# Altium project DC Electronic Load Redemption Edition.PrjPcb
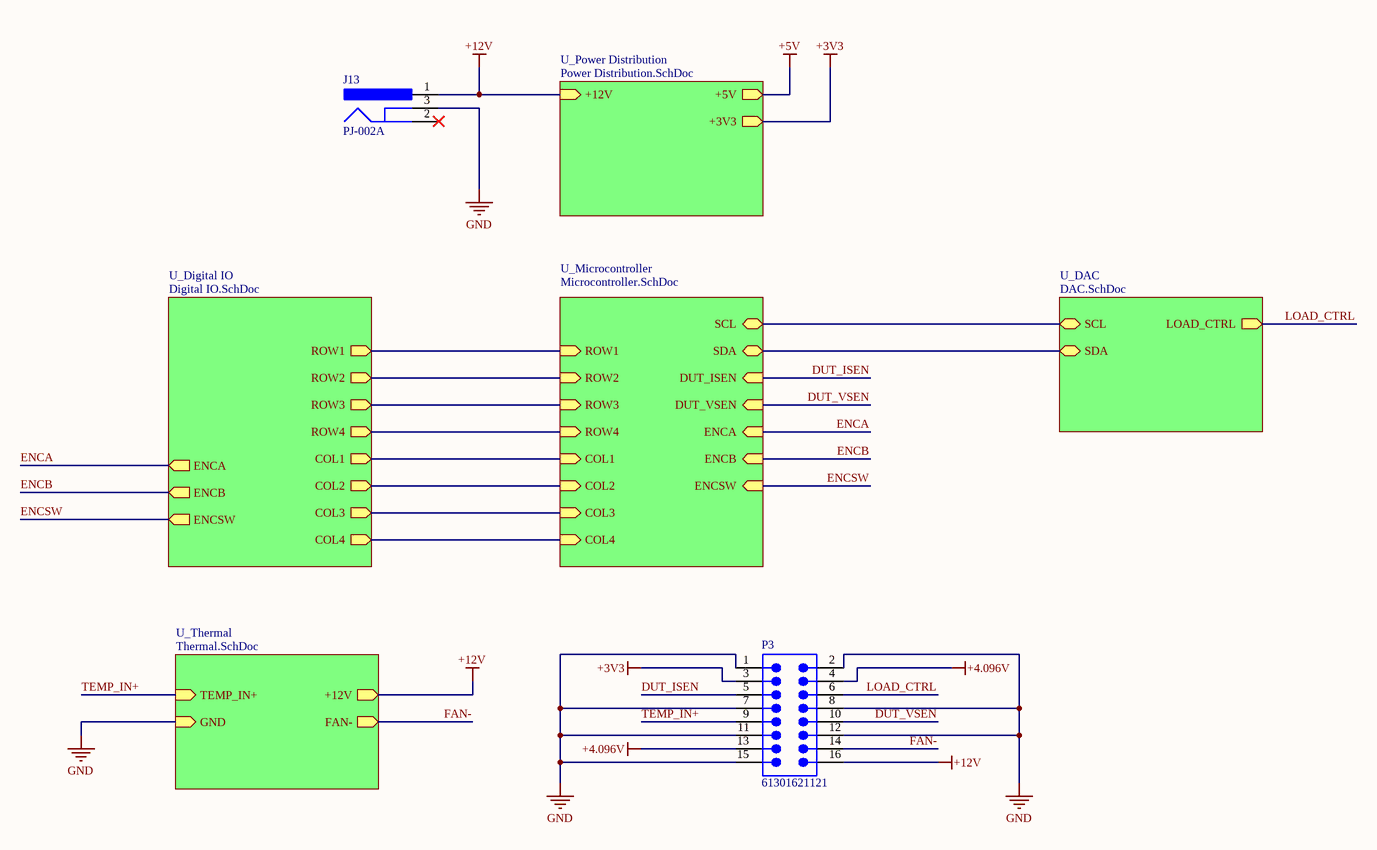
[diagram p0: Top.SchDoc]
5 sheets, 84 parts. Net scope: hierarchical (ports join the sheet entries above them; power ports are global).
Board file: DC Load Control Board.PcbDoc
Sheets:
  Top.SchDoc
    U_Power Distribution = Power Distribution.SchDoc
    U_DAC = DAC.SchDoc
    U_Thermal = Thermal.SchDoc
    U_Microcontroller = Microcontroller.SchDoc

## Sheet Top.SchDoc
size B; SheetNumber: 1; SheetTotal: 6

### Parts
J13  PJ-002A  [CUI-PJ-002A_V]
P3  61301621121  [61301621121]

### Sub-sheets
U_DAC = DAC.SchDoc: SCL (bidir), SDA (bidir), LOAD_CTRL (out)
U_Digital IO = Digital IO.SchDoc (file not in this document): ROW1 (out), ROW2 (out), ROW3 (out), ROW4 (out), COL1 (out), COL2 (out), COL3 (out), COL4 (out), ENCA (out), ENCB (out), ENCSW (out)
U_Microcontroller = Microcontroller.SchDoc: DUT_ISEN (in), DUT_VSEN (in), ROW1 (in), ROW2 (in), ROW3 (in), ROW4 (in), ENCA (in), ENCB (in), ENCSW (in), COL1 (in), COL2 (in), COL3 (in), COL4 (in), SCL (bidir), SDA (bidir)
U_Power Distribution = Power Distribution.SchDoc: +12V (in), +5V (out), +3V3 (out)
U_Thermal = Thermal.SchDoc: FAN- (out), TEMP_IN+ (in), +12V (out), GND (in)

### Nets
+3V3: P3.3 ; sheet U_Power Distribution/+3V3
+4.096V: P3.4 P3.13
+12V: J13.1 P3.16 ; sheet U_Power Distribution/+12V, sheet U_Thermal/+12V
GND: J13.3 P3.1 P3.2 P3.7 P3.8 P3.11 P3.12 P3.15 ; sheet U_Thermal/GND
COL1: sheet U_Digital IO/COL1, sheet U_Microcontroller/COL1
COL2: sheet U_Digital IO/COL2, sheet U_Microcontroller/COL2
COL3: sheet U_Digital IO/COL3, sheet U_Microcontroller/COL3
COL4: sheet U_Digital IO/COL4, sheet U_Microcontroller/COL4
DUT_ISEN: P3.5 ; sheet U_Microcontroller/DUT_ISEN
DUT_VSEN: P3.10 ; sheet U_Microcontroller/DUT_VSEN
ENCA: sheet U_Digital IO/ENCA, sheet U_Microcontroller/ENCA
ENCB: sheet U_Digital IO/ENCB, sheet U_Microcontroller/ENCB
ENCSW: sheet U_Digital IO/ENCSW, sheet U_Microcontroller/ENCSW
FAN-: P3.14 ; sheet U_Thermal/FAN-
LOAD_CTRL: P3.6 ; sheet U_DAC/LOAD_CTRL
ROW1: sheet U_Digital IO/ROW1, sheet U_Microcontroller/ROW1
ROW2: sheet U_Digital IO/ROW2, sheet U_Microcontroller/ROW2
ROW3: sheet U_Digital IO/ROW3, sheet U_Microcontroller/ROW3
ROW4: sheet U_Digital IO/ROW4, sheet U_Microcontroller/ROW4
TEMP_IN+: P3.9 ; sheet U_Thermal/TEMP_IN+
NetJ4_1: sheet U_DAC/SCL, sheet U_Microcontroller/SCL
NetJ5_1: sheet U_DAC/SDA, sheet U_Microcontroller/SDA

Not connected (* = marked no-connect by the designer): J13 2*

### Library data of the parts
J13 = CMP-2000-06895-2: Through Hole Right Angle DC Power Jack, 2.5 A, 2 mm Center Pin, 3 Position, -25 to 85 degC, RoHS, Bulk; Manufacturer: CUIInc.; Brand: CUI; Inside Contact Diameter: 2mm; Voltage Rating: 24V; Outside Contact Diameter: 6.5mm; Current Rating: 2.5A; Insulation Resistance: 50MOhms; Contact Gender: Male; Connector Type: DCPowerJack; Datasheet Version: Rev. 1.03, 04/2016; Housing Material: PolybutyleneTerephthalate(PBT); Operating Temperature Range: -25Cto+85C; Termination Style: ThroughHole; Product Category: DCPowerConnectors; Mounting Technology: ThroughHole; Mounting Style: ThroughHole; Factory Pack Quantity: 500; Contact Plating: Nickel; Package Reference: PJ-002A; Mounting Angle: Right; Package Description: 3-Pin Through Hole Device, Body 14.4 x 9 mm, Height 11 mm; Flammability Rating: UL94V-0; Manufacturer URL: http://www.cui.com/; Product: Jacks; Contact Material: Copper; Datasheet URL: http://www.cui.com/product/resource/pj-002a.pdf; RoHS: True
P3 = CMP-1502-01097-3: NexarPartId: 32855550; Contact Resistance: 20mΩ; Operating Supply Voltage: 250V; Number of Contacts: 16; Current Rating: 3A; Connector Type: Male Pin; Row Spacing: 2.54mm; Gender: Male; Min Operating Temperature: -40°C; Contact Material: Copper; RoHS: Compliant; Lead Pitch: 2.54mm; Color: Black; Contact Mating Length: 5.9944mm; REACH SVHC: Unknown; Number of Rows: 2; Orientation: Vertical; Number of Positions: 16; Max Operating Temperature: 105°C; Termination: Solder; Packaging: Bulk; Height: 8.89mm; Mount: Through Hole; Contact Plating: Gold; Voltage Rating: 250V; Number of Pins: 16; Pitch: 2.54mm

## Sheet Power Distribution.SchDoc
size B; SheetNumber: 3; SheetTotal: 6
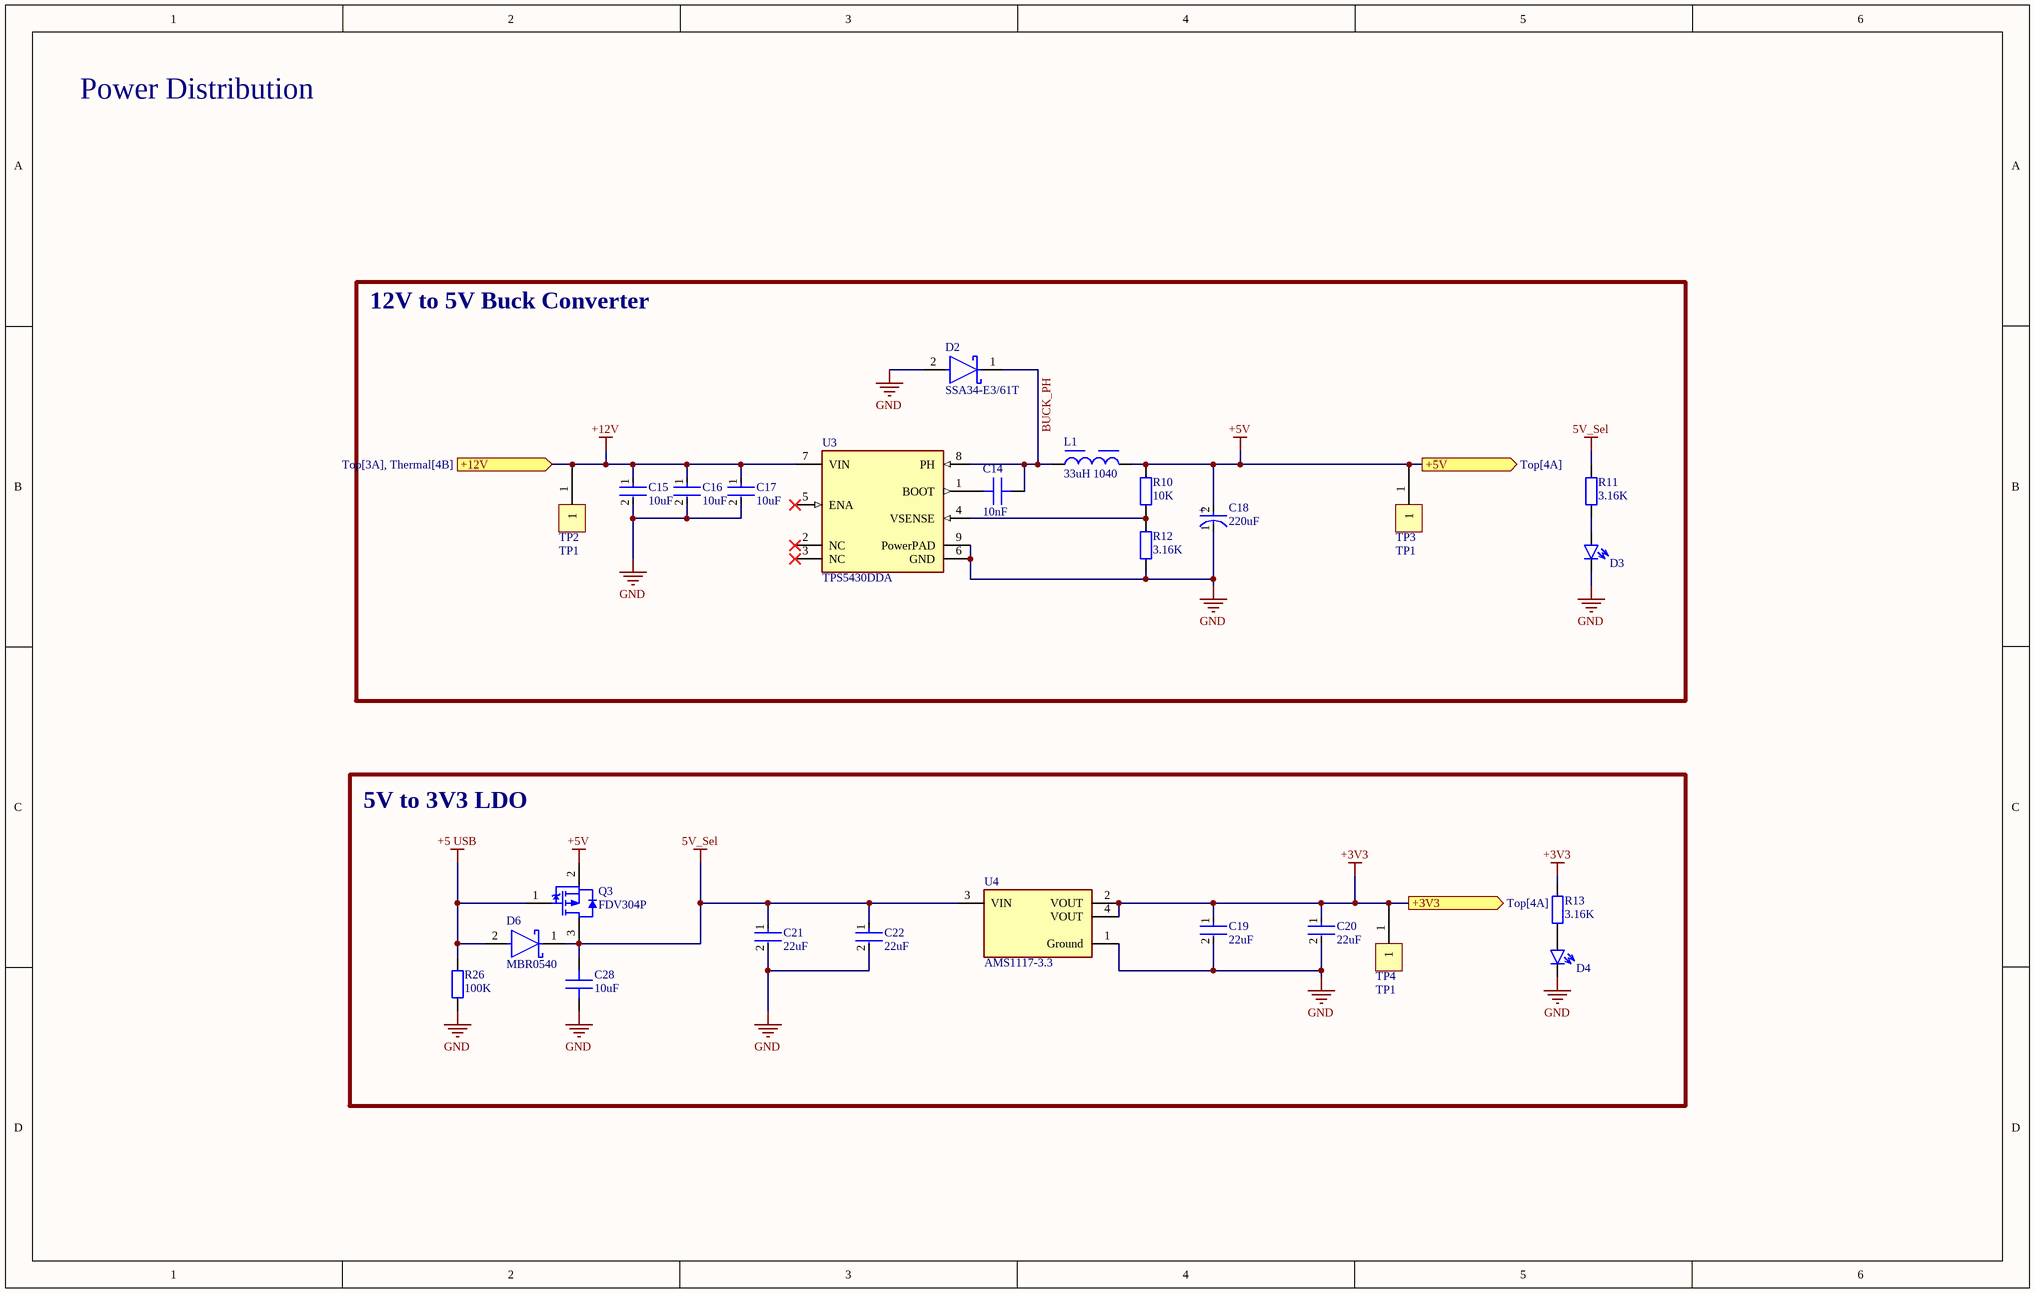
[diagram p1: Power Distribution.SchDoc]

### Parts
C14  10nF  [IPC C C0402 NO SILK]
C15  10uF  [FP-GRM21B-0_1-IPC_C]
C16  10uF  [FP-GRM21B-0_1-IPC_C]
C17  10uF  [FP-GRM21B-0_1-IPC_C]
C18  220uF  [FP-UCW1H221MNL1GS-MFG]
C19  22uF  [FP-GRM21B-0_15-MFG]
C20  22uF  [FP-GRM21B-0_15-MFG]
C21  22uF  [FP-GRM21B-0_15-MFG]
C22  22uF  [FP-GRM21B-0_15-MFG]
C28  10uF  [IPC C C0603 NO SILK]
D2  SSA34-E3/61T  [FP-95400-MFG]
D3  Generic LED 0603  [IPC C D0603]  (value not drawn)
D4  Generic LED 0603  [IPC C D0603]  (value not drawn)
D6  MBR0540  [FP-425-04-MFG]
L1  33uH 1040  [WE-LHMI_1040]
Q3  FDV304P  [FAIR-SOT23-3_V]
R10  10K  [IPC C R0402 NO SILK]
R11  3.16K  [IPC C R0402 NO SILK]
R12  3.16K  [IPC C R0402 NO SILK]
R13  3.16K  [IPC C R0402 NO SILK]
R26  100K  [IPC C R0603 NO SILK]
TP2  TP1  [TP1]
TP3  TP1  [TP1]
TP4  TP1  [TP1]
U3  TPS5430DDA  [FP-DDA0008J-MFG]
U4  AMS1117-3.3  [FP-AMS1117-IPC_C]

### Blocks framed on the sheet
12V to 5V Buck Converter: C14-C18 D2 D3 L1 R10-R12 TP2 TP3 U3
5V to 3V3 LDO: C19-C22 C28 D4 D6 Q3 R13 R26 TP4 U4

### Ports
+3V3 (out, see Top[4A]), +5V (out, see Top[4A]), +12V (in, see Top[3A], Thermal[4B])

### Nets
5V_Sel: C21.1 C22.1 C28.2 D6.1(C) Q3.3(D) R11.2 U4.3(VIN)
+3V3: C19.1 C20.1 R13.2 TP4.1 U4.2(VOUT) U4.4(VOUT) ; port +3V3
+5 USB: D6.2(A) Q3.1(G) R26.2
+5V: C18.2(A) L1.2 Q3.2(S) R10.2 TP3.1 ; port +5V
+12V: C15.1 C16.1 C17.1 TP2.1 U3.7(VIN) ; port +12V
GND: C15.2 C16.2 C17.2 C18.1(C) C19.2 C20.2 C21.2 C22.2 C28.1 D2.2(A) D3.2(C) D4.2(C) R12.1 R26.1 U3.6(GND) U3.9(PowerPAD) U4.1(Ground)
BUCK_PH: C14.2 D2.1(C) L1.1 U3.8(PH)
NetC14_1: C14.1 U3.1(BOOT)
NetD3_1: D3.1(A) R11.1
NetD4_1: D4.1(A) R13.1
NetR10_1: R10.1 R12.2 U3.4(VSENSE)

Not connected (* = marked no-connect by the designer): U3 2(NC)* 3(NC)* 5(ENA)*

### Notes on the sheet
- Power Distribution
- (in symbol CMP-12462-000041-1) +

### Library data of the parts
C14 = CMP-002-000000-1: Value: 10nF; Source: Schlib1.SchLib; Design Item ID: Generic CAP 0402
C15-C17 = CMP-2007-03453-2: GRM21BR61C106KE15L; Chip Multilayer Ceramic Capacitors for General Purpose, 0805, 10uF, X5R, 15%, 10%, 16V; Radiation Hardening: No; Thickness: 0.053inch; Voltage Rating (DC): 16V; Lead Free: Lead Free; Package Quantity: 1; Width: 1.25mm; Case Code (Imperial): 0805; Depth: 1.25mm; Packaging: Tape and Reel; Dielectric: X5R; Max Operating Temperature: 85°C; Tolerance: 10%; Voltage Rating: 16V; Voltage: 16V; Capacitance: 10uF; Height: 1.25mm; Case Code (Metric): 2012; Material: Ceramic; Mount: Surface Mount; Case/Package: 0805; REACH SVHC: No SVHC; Length: 2mm; Min Operating Temperature: -55°C; Termination: SMD/SMT
C18 = CMP-12462-000041-1: UCW1H221MNL1GS; CAP ALUM 220UF 20% 50V SMD; Dissipation Factor: 0.14%; Ripple Current: 670mA; Dielectric Material: Aluminium; Life (Hours): 7000Hour; Impedance: 350mR; Leakage Current: 3uA; Capacitance: 220uF; Max Operating Temperature: 105°C; Features: General Purpose; Voltage Rating: 50V; Case/Package: Radial; Termination: SMD/SMT; Tolerance: 20%; Package Quantity: 500; Construction: Cylindrical; REACH SVHC: No SVHC; Width: 10.3mm; Min Operating Temperature: -25°C; RoHS Compliant: Yes; Mount: Surface Mount; Diameter: 10mm; Voltage: 50V; Series: CW; Voltage Rating (DC): 50V; Ripple Current (AC): 670mA; Radiation Hardening: No; Length: 10mm; Packaging: Tape and Reel; Height: 10mm; Height - Seated (Max): 0.394inch
C19-C22 = CMP-2007-03385-2: GRM21BR60J226ME39L; Chip Multilayer Ceramic Capacitors for General Purpose, 0805, 22uF, X5R, 15%, 20%, 6.3V; Material: Ceramic; Max Operating Temperature: 85°C; Voltage: 6.3V; Min Operating Temperature: -55°C; Case/Package: 0805; Thickness: 0.053inch; Dielectric: X5R; Packaging: Tape and Reel; Depth: 1.25mm; Termination: SMD/SMT; Voltage Rating (DC): 6.3V; Radiation Hardening: No; Tolerance: 20%; Mount: Surface Mount; Lead Free: Lead Free; Package Quantity: 1; REACH SVHC: No SVHC; Voltage Rating: 6.3V; Capacitance: 22uF; Length: 2mm; Case Code (Imperial): 0805; Case Code (Metric): 2012; Width: 0.049inch; Height: 1.25mm
C28 = CMP-002-000001-1: Value: 10uF; Source: Schlib1.SchLib; Design Item ID: Generic CAP 0603
D2 = CMP-02539-000022-2: DIODE SCHOTTKY 40V 3A DO214AC; Element Configuration: Single; Max Reverse Leakage Current: 200uA; Polarity: Standard; Peak Non-Repetitive Surge Current: 75A; Forward Voltage: 490mV; Radiation Hardening: No; Current Rating: 3A; Contact Plating: Tin; Output Current: 3A; Height: 2.087mm; Mount: Surface Mount; Case/Package: SMA; Packaging: Tape and Reel; Width: 2.79mm; Average Rectified Current: 3A; Max Repetitive Reverse Voltage (Vrrm): 40V; Max Operating Temperature: 150°C; Length: 4.5mm; RoHS Compliant: Yes; Max Reverse Current: 200uA; Voltage Rating (DC): 40V; Min Operating Temperature: -65°C; Max Reverse Voltage (DC): 40V; Number of Pins: 2; Max Forward Surge Current (Ifsm): 75A; Lead Free: Lead Free; Forward Current: 3A; Max Surge Current: 75A; Package Quantity: 1
D3 D4 = CMP-006-000001-1: Design Item ID: Generic LED 0603; Source: Schlib1.SchLib
D6 = CMP-2000-05114-2: DIODE SCHOTTKY 40V 500MA SOD123; Max Surge Current: 5.5A; Max Reverse Leakage Current: 20uA; Forward Voltage: 620mV; Element Configuration: Single; Polarity: Standard; Power Dissipation: 400mW; Current Rating: 500A; Max Operating Temperature: 125°C; REACH SVHC: No SVHC; Voltage Rating (DC): 40V; Mount: Surface Mount; Max Reverse Voltage (DC): 40V; Max Forward Surge Current (Ifsm): 5.5A; Height: 1.03mm; Package Quantity: 3000; Forward Current: 500mA; Average Rectified Current: 500mA; Weight: 0.03g; Output Current: 500mA; Contact Plating: Tin; Packaging: Tape and Reel; Width: 1.6mm; Radiation Hardening: No; Peak Non-Repetitive Surge Current: 5.5A; Max Repetitive Reverse Voltage (Vrrm): 40V; Length: 2.7mm; Lead Free: Lead Free; Min Operating Temperature: -65°C; Number of Pins: 2; Peak Reverse Current: 20uA
L1 = CMP-1353-00014-4: NexarPartId: 67091305; Saturation Current: 3.3A; DC Resistance (DCR): 92mΩ; Inductance Tolerance: 20%; Inductance: 33µH; Max Operating Temperature: 125°C; Ambient Temperature Range High: 85°C; Min Operating Temperature: -40°C; Length: 11mm; Ambient Temperature Range Low: -40°C; Height: 3.8mm; Width: 10mm; RoHS: Compliant
Q3 = CMP-2000-06263-1: P-Channel Digital FET, -25 V, -0.46 A, 0.35 W, -55 to 150 degC, 3-Pin SOT-23, -55 to 150 degC, RoHS, Tape and Reel; Manufacturer: FairchildSemiconductor; Rad Hard: No; Typical Fall Time: 35ns; Typical Rise Time: 8ns; Channel Mode: Enhancement; Maximum Continuous Drain Current: 0.46A; RDS-on: 1100@4.5VmOhm; Maximum Drain Source Voltage: 25V; Package Version: Rev. 12, 03/2016; Typical Turn-On Delay Time: 6ns; Maximum Gate Source Voltage: 8V; Channel Type: P; Typical Turn-Off Delay Time: 55ns; Datasheet Version: Rev. E1, 08/1997; Package Description: 3-Pin Small Outline Transistor, Body 2.92 x 1.325 mm, Pitch 0.95 mm; Operating Temperature: -55to150°C; Package Reference: SOT23-3; Manufacturer URL: https://www.fairchildsemi.com/; Package URL: http://www.fairchildsemi.com/dwg/MA/MA03D.pdf; Package: 3SOT-23; Category: MOSFET; Packaging: Tape&Reel; Mounting: SurfaceMount; Datasheet URL: https://www.fairchildsemi.com/datasheets/FD/FDV304P.pdf; Mounting Technology: SurfaceMount
R10-R13 = CMP-008-000000-1: Generic RES 0402; Source: Schlib1.SchLib; Design Item ID: Generic RES 0402
  R10: Value: 10K
  R11-R13: Value: 3.16K
R26 = CMP-008-000001-1: Value: 100K; Source: Schlib1.SchLib; Design Item ID: Generic RES 0603
TP2-TP4 = CMP-00003-3: Testpoint double sided
U3 = CMP-2000-04960-2: IC REG BUCK ADJUSTABLE 3A 8SOPWR; Manufacturer: Texas Instruments; Max Junction Temp: +125°C; Max Supply Voltage: 36V; Switching Frequency: 500kHz; Output Type: AdjustableProgrammable; Standoff Height: 0mm; Output Voltage: 1.23-31V; Max Duty Cycle: 89%; Nominal Supply Current: 3mA; Min Supply Voltage: 5.5V; Number Of Outputs: 1; Temperature: -40°C to +125°C; Temperature Range High: +125°C; Manufacturer Part Number: TPS5430DDA; Device Class L3: Voltage Regulators - Switching; Mouser Description: Voltage Regulators - Switching Regulators 5.5 to 36V Input 3A Step Dwn Converter; Switching Topology: Buck; ComponentLink2URL: http://www.ti.com/lit/ds/symlink/tps5431.pdf; ComponentLink2Description: Datasheet; Device Class L2: Power Management ICs; Device Class L1: Integrated Circuits (ICs); Digikey Description: IC REG BUCK ADJUSTABLE 3A 8SOPWR; RoHS: TRUE; Octopart: https://octopart.com/tps5430dda-texas+instruments-589977; Output Current: 3A; Automotive: No; Lead Free: Yes; Category: IC; Package: DDA0008J; Temperature Range Low: -40°C; Height: 1.7mm
U4 = CMP-209535-000001-1: LDO Voltage Regulators 1A, 3.3V; Manufacturer: Advanced Monolithic Systems; Dropout Voltage: 1.1V; Output Type: Fixed; Nominal Supply Current: 5mA; Max Power Dissipation: 1.2W; Max Supply Voltage: 15V; Number Of Outputs: 1; Standoff Height: 0.64mm; Max Junction Temp: +125°C; Height: 1.8mm; Package: AMS1117; Device Class L2: Power Management ICs; ComponentLink2Description: Datasheet; ComponentLink2URL: http://www.advanced-monolithic.com/pdf/ds1117.pdf; Category: IC; RoHS: TRUE; Automotive: No; Device Class L1: Integrated Circuits (ICs); Output Current: 1A; Device Class L3: Voltage Regulators - Linear; Temperature: -40°C to +125°C; Output Voltage: 3.3V; Manufacturer Part Number: AMS1117-3.3; Temperature Range Low: -40°C; Octopart: https://octopart.com/ams1117-3.3-advanced+monolithic+systems-25899300; Lead Free: Yes; Ipc Land Pattern Name: SOT229P700X180-4; Temperature Range High: +125°C

## Sheet DAC.SchDoc
size B; SheetNumber: 4; SheetTotal: 6
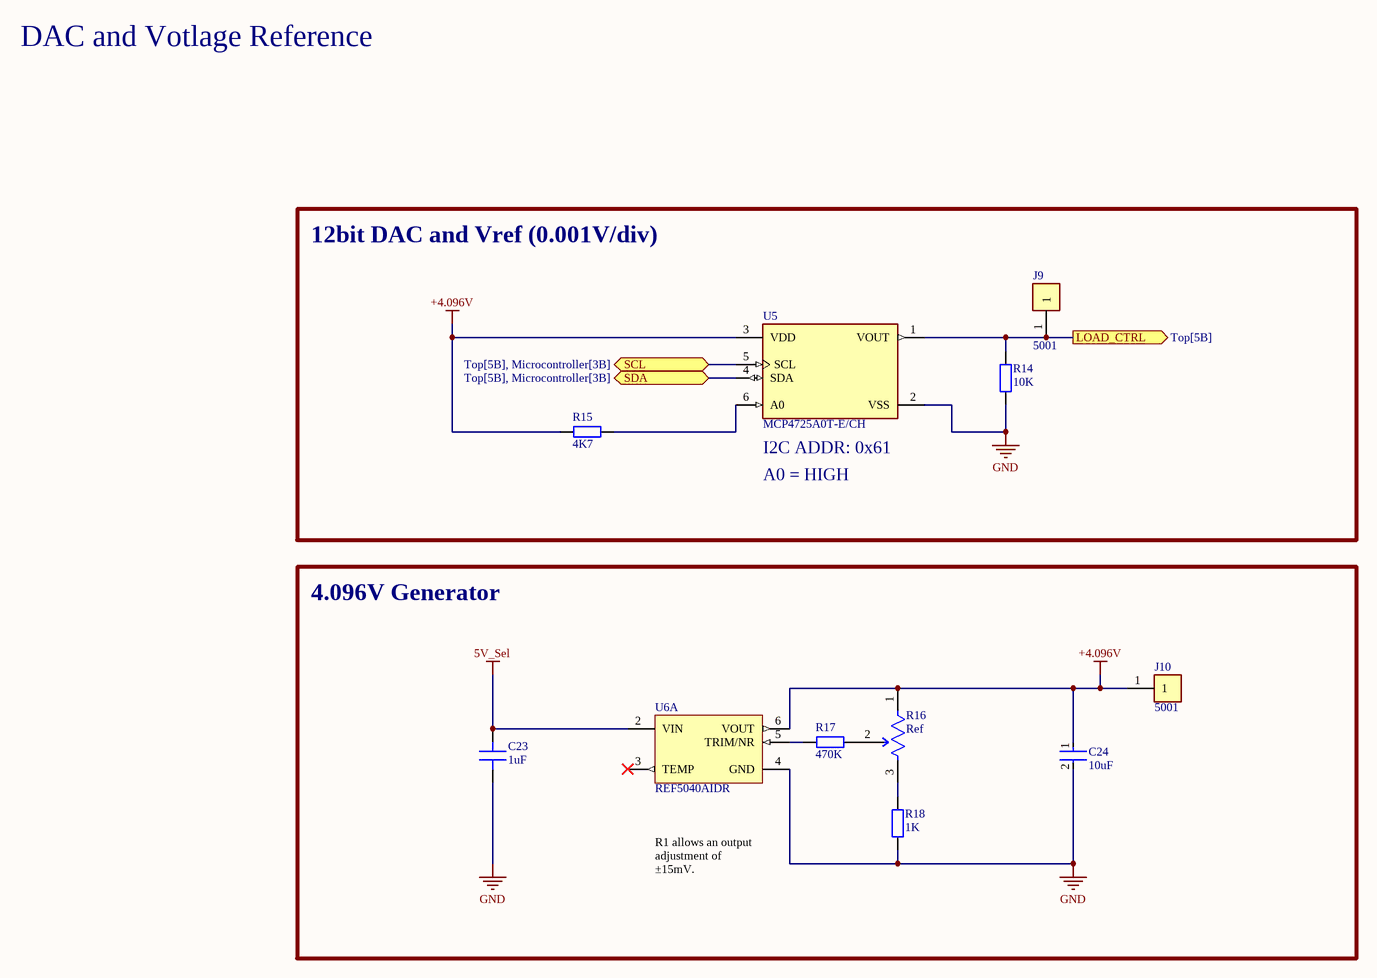
[diagram p2: DAC.SchDoc]

### Parts
C23  1uF  [IPC C C0603 NO SILK]
C24  10uF  [FP-GRM21B-0_1-IPC_C]
J9  5001  [FP-5001-MFG]
J10  5001  [FP-5001-MFG]
R14  10K  [IPC C R0402 NO SILK]
R15  4K7  [IPC C R0402 NO SILK]
R16  Ref  [FP-3296Y-MFG]
R17  470K  [IPC C R0603 NO SILK]
R18  1K  [IPC C R0402 NO SILK]
U5  MCP4725A0T-E/CH  [FP-C04-028-CHY-IPC_A]
U6  REF5040AIDR  [D0008A_M]  (part A of 2)

### Blocks framed on the sheet
12bit DAC and Vref (0.001V/div): J9 R14 R15 U5
4.096V Generator: C23 C24 J10 R16-R18 U6

### Ports
LOAD_CTRL (out, see Top[5B]), SCL (bidir, see Top[5B], Microcontroller[3B]), SDA (bidir, see Top[5B], Microcontroller[3B])

### Nets
5V_Sel: C23.2 U6.2(VIN)
+4.096V: C24.1 J10.1 R15.2 R16.1(CCW) U5.3(VDD) U6.6(VOUT)
GND: C23.1 C24.2 R14.1 R18.1 U5.2(VSS) U6.4(GND)
LOAD_CTRL: J9.1 R14.2 U5.1(VOUT) ; port LOAD_CTRL
NetJ4_1: U5.5(SCL) ; port SCL
NetJ5_1: U5.4(SDA) ; port SDA
NetR15_1: R15.1 U5.6(A0)
NetR16_2: R16.2(WIPER) R17.2
NetR16_3: R16.3(CW) R18.2
NetR17_1: R17.1 U6.5(TRIM/NR)

Not connected (* = marked no-connect by the designer): U6 3(TEMP)*

### Notes on the sheet
- DAC and Votlage Reference
- (near U5) I2C ADDR: 0x61
- A0 = HIGH
- R1 allows an output adjustment of ±15mV.

### Library data of the parts
C23 = CMP-002-000001-1: Source: Schlib1.SchLib; Design Item ID: Generic CAP 0603; Value: 1uF
C24 = CMP-2007-03453-2: as C15 on sheet Power Distribution; Radiation Hardening: No; Thickness: 0.053inch; Voltage Rating (DC): 16V; Lead Free: Lead Free; Package Quantity: 1; Width: 1.25mm; Case Code (Imperial): 0805; Depth: 1.25mm; Packaging: Tape and Reel; Dielectric: X5R; Max Operating Temperature: 85°C; Tolerance: 10%; Voltage Rating: 16V; Voltage: 16V; Capacitance: 10uF; Height: 1.25mm; Case Code (Metric): 2012; Material: Ceramic; Mount: Surface Mount; Case/Package: 0805; REACH SVHC: No SVHC; Length: 2mm; Min Operating Temperature: -55°C; Termination: SMD/SMT
J9 J10 = CMP-2000-05181-2: PC TEST POINT MINIATURE BLACK; Body Material: Bronze; Plating: Silver; Inside Diameter: 1.27mm; Hole Diameter: 1.6mm; Number of Ports: 1; Outside Diameter: 2.54mm; Insulation: Insulated; Insulation Material: Nylon; Mount: Through Hole; RoHS Compliant: Yes; Series: THM; Height: 0.3inch; Termination: Through Hole; Material: Nylon; Packaging: Bulk; Contact Material: Bronze; REACH SVHC: No SVHC; Contact Plating: Silver; Orientation: Straight; Lead Free: Lead Free; Package Quantity: 100; Length: 7.62mm; Flammability Rating: UL94 V-0; Number of Contacts: 1; Diameter: 2.54mm; Housing Color: Black; Color: Black
R14 R15 R18 = CMP-008-000000-1: Source: Schlib1.SchLib; Design Item ID: Generic RES 0402
  R14: Value: 10K
  R15: Value: 4K7
  R18: Value: 1K
R16 = CMP-07234-000015-2: TRIMMER 10K OHM 0.5W PC PIN TOP; Manufacturer Series: 3296; Actuator Orientation: Vertical; Power Rating: 500mW; Temperature Coefficient: 100ppm/°C; Resistance Tolerance: 10%; Resistance Law: Linear; Number of Turns: 25; Actuator Type: SCREW; Number of Terminals/Pins: 3; Insulation Resistance: 1GR; Resistance: 10k; Military Standard: Not; REACH SVHC: No SVHC; Lead Free: Lead Free; Resistor Type: Cermet; Max Operating Temperature: 125°C; Radiation Hardening: No; Package Quantity: 50; Mount: Panel; Max Power Dissipation: 500mW; Min Operating Temperature: -55°C; Type: Potentiometer; Terminal Finish: Tin; Termination: Pin; Taper: Linear; Color: Blue; Technology: CERMET; Packaging: Rail/Tube; Weight: 0.03oz; Height: 0.395inch; Number of Pins: 3; RoHS Compliant: Yes; Width: 9.53mm; Tolerance: 10%; Depth: 4.83mm; Series: 3296; Length: 9.53mm
R17 = CMP-008-000001-1: Value: 470K; Source: Schlib1.SchLib; Design Item ID: Generic RES 0603
U5 = CMP-0188-00760-3: IC DAC 12BIT V-OUT SOT23-6; Number of Outputs: 1; Supply Type: Single; Integral Nonlinearity (INL): 14.5LSB; Polarity: Unipolar; Number of Bits: 12; Min Supply Voltage: 2.7V; Output Type: Voltage; Settling Time: 6us; Max Supply Voltage: 5.5V; Nominal Supply Current: 210uA; Resolution: 12b; Interface: I2C; Input Offset Voltage (Vos): 1.1mV; Radiation Hardening: No; Number of DAC Channels: 1; Length: 3.1mm; Number of D/A Converters: 1; Number of Pins: 6; Case/Package: SOT-23-6; Lead Free: Lead Free; Number of Channels: 1; Termination: SMD/SMT; Width: 1.8mm; Contact Plating: Tin; Package Quantity: 3000; Max Operating Temperature: 125°C; Min Operating Temperature: -40°C; REACH SVHC: No SVHC; Mount: Surface Mount; Height: 1.3mm; Packaging: Tape and Reel; Number of Converters: 1
U6 = CMP-0367-00019-2: Low Noise, Very Low Drift, Precision Voltage Reference, -40 to 125 degC, 8-pin SOIC (D), Green (RoHS & no Sb/Br); Manufacturer: Texas Instruments; Initial Accuracy @ 25/deg C(%): 0.05; VO(V): 4.096; VI(Max)(V): 18; Temp Coeff(Max)(ppm/ degree C): 3; Iq(Max)(uA): 1000; VI(Min)(V): 4.296; Rating: Catalog; SubFamily: Series Voltage Reference; Iout/Iz(Max)(mA): 10; PartNumber: REF5040AIDR; Code_JEDEC: MS-012; PackageReference: D0008A; PackageDescription: 8-Pin Plastic Small Outline, Body 4.9 x 3.9 mm, Pitch 1.27 mm; ComponentLink3Description: Package Specification; Mounting Technology: Surface Mount; ComponentLink2Description: Datasheet; PackageVersion: 4040047-3/M; ComponentLink1URL: http://www.ti.com/; ComponentLink1Description: Manufacturer URL; ComponentLink2URL: http://www.ti.com/general/docs/lit/getliterature.tsp?genericPartNumber=REF5040&fileType=pdf; ComponentLink3URL: http://www.ti.com/litv/pdf/msoi002j; Eco-Plan: Green (RoHS & no Sb/Br); DatasheetVersion: SBOS410E

## Sheet Thermal.SchDoc
size B; SheetNumber: 5; SheetTotal: 6
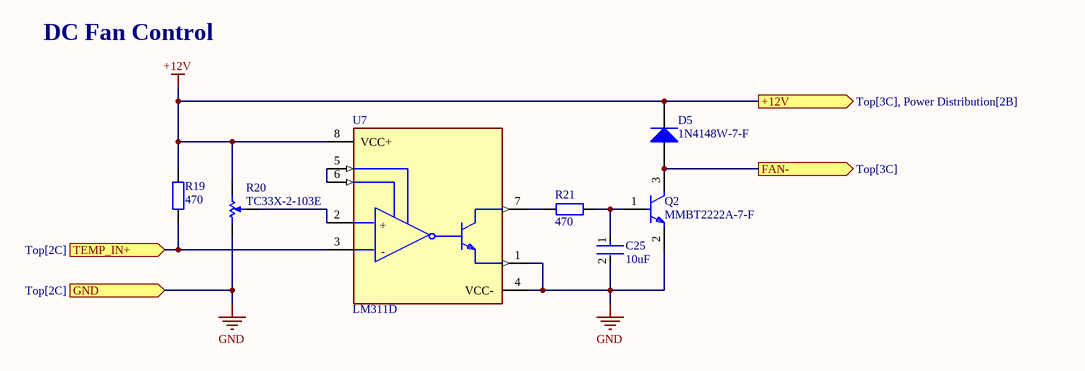
[diagram p3: Thermal.SchDoc]

### Parts
C25  10uF  [FP-GRM21B-0_1-IPC_C]
D5  1N4148W-7-F  [DIOD-SOD123-2_V]
Q2  MMBT2222A-7-F  [FP-SOT23-IPC_A]
R19  470  [IPC C R0402 NO SILK]
R20  TC33X-2-103E  [BOUR-TC33X-2_V]
R21  470  [IPC C R0402 NO SILK]
U7  LM311D  [FP-D0008A-MFG]

### Ports
+12V (out, see Top[3C], Power Distribution[2B]), FAN- (out, see Top[3C]), GND (in, see Top[2C]), TEMP_IN+ (in, see Top[2C])

### Nets
+12V: D5.2(K) R19.1 R20.3 U7.8(VCC+) ; port +12V
GND: C25.2 Q2.2(E) R20.1 U7.1(EMIT_OUT) U7.4(VCC-) ; port GND
FAN-: D5.1(A) Q2.3(C) ; port FAN-
TEMP_IN+: R19.2 U7.3(IN-) ; port TEMP_IN+
NetC25_1: C25.1 Q2.1(B) R21.2
NetR20_2: R20.2 U7.2(IN+)
NetR21_1: R21.1 U7.7(COL_OUT)
NetU7_5: U7.5(BALANCE) U7.6(BAL/STRB)

### Notes on the sheet
- DC Fan Control
- (in symbol CMP-04896-000022-1) +; -

### Library data of the parts
C25 = CMP-2007-03453-2: as C15 on sheet Power Distribution; Radiation Hardening: No; Thickness: 0.053inch; Voltage Rating (DC): 16V; Lead Free: Lead Free; Package Quantity: 1; Width: 1.25mm; Case Code (Imperial): 0805; Depth: 1.25mm; Packaging: Tape and Reel; Dielectric: X5R; Max Operating Temperature: 85°C; Tolerance: 10%; Voltage Rating: 16V; Voltage: 16V; Capacitance: 10uF; Height: 1.25mm; Case Code (Metric): 2012; Material: Ceramic; Mount: Surface Mount; Case/Package: 0805; REACH SVHC: No SVHC; Length: 2mm; Min Operating Temperature: -55°C; Termination: SMD/SMT
D5 = CMP-2000-04932-2: Fast Switching Diode, 100 V, 0.15 A, -65 to 150 degC, 2-Pin?SOD123, RoHS, Tape and Reel; Recovery Time: 4ns; Brand: DiodesIncorporated; Unit Weight: 0.000353oz; Max Surge Current: 2A; Peak Reverse Voltage: 100V; Ir - Reverse Current: 1uA; Vf - Forward Voltage: 1.25V; Configuration: Single; If - Forward Current: 0.15A; Product Category: Diodes-GeneralPurpose,Power,Switching; Operating Temperature Range: -65Cto+150C; Packaging: Reel; Manufacturer URL: http://www.diodes.com/; Maximum Operating Temperature: +150C; Height: 1.25mm; Minimum Operating Temperature: -65C; Product: SwitchingDiodes; Package URL: http://www.diodes.com/datasheets/ds18004.pdf; Type: SwitchingDiode; Package Reference: SOD123-2; Width: 1.7mm; Datasheet URL: http://www.farnell.com/datasheets/1915529.pdf; Datasheet Version: Rev. 24-2, 10/2013; Series: 1N4148; Factory Pack Quantity: 3000; Length: 2.85mm; RoHS: True; Manufacturer: DiodesIncorporated; Mounting Style: SMD/SMT; Package / Case: SOD-123
Q2 = CMP-1693-00003-4: TRANS NPN 40V 0.6A SMD SOT23-3; Number of Elements: 1; Frequency: 300MHz; Max Collector Current: 600mA; Collector Base Voltage (VCBO): 75V; Current: 1A; Element Configuration: Single; Power Dissipation: 350mW; hFE Min: 100; Collector Emitter Saturation Voltage: 1V; Max Power Dissipation: 300mW; Emitter Base Voltage (VEBO): 6V; Voltage: 40V; Collector Emitter Breakdown Voltage: 40V; Width: 1.4mm; Polarity: NPN; Termination: SMD/SMT; Max Operating Temperature: 150°C; Transition Frequency: 300MHz; Contact Plating: Tin; Mount: Surface Mount; Max Frequency: 300MHz; Case/Package: SOT-23; Gain Bandwidth Product: 300MHz; Lead Free: Lead Free; Collector Emitter Voltage (VCEO): 40V; Radiation Hardening: No; Voltage Rating (DC): 40V; Height: 1mm; Max Breakdown Voltage: 40V; Packaging: Tape and Reel; Length: 3.05mm; Min Operating Temperature: -55°C; Weight: 0.000282oz; Current Rating: 600mA; REACH SVHC: No SVHC; Package Quantity: 3000; Continuous Collector Current: 600mA; Number of Pins: 3
R19 R21 = CMP-008-000000-1: Value: 470; Source: Schlib1.SchLib; Design Item ID: Generic RES 0402
R20 = CMP-2100-03695-1: Trimming Potentiometer, 10000 Ohm, -40 to 100 degC, 3-Pin SMD, RoHS, Tape and Reel; Manufacturer: Bourns; Tolerance: 25%; Max Power Dissipation: 100mW; Number of Turns: 1; Resistance: 10KOhm; Temperature Coefficient: 250ppm/degreesC; Voltage Rating (DC): 50V; Datasheet URL: http://www.bourns.com/docs/Product-Datasheets/TC33.pdf; Composition: Potentiometer; Package Description: 3-Pin Surface Mount Device, Body 3.8 x 3.6 mm; Weight: 29.4mg; Power Rating: 100mW; Termination: FootPrint; Manufacturer URL: http://www.bourns.com/; Width: 0.118inch; Height: 0.047inch; Military Standard: Not; Radiation Hardening: No; Colour: Silver; Case/Package: SMD/SMT; Depth: 3.8mm; Min Operating Temperature: -40degC; Lead Free: LeadFree; Datasheet Version: 42583.0; REACH SVHC: NoSVHC; Length: 3mm; RoHSCompliant: true; Contact Plating: Silver; Taper: Linear; Packaging: TapeandReel; Mount: SurfaceMount; Max Operating Temperature: 100degC; Package Reference: TC33X-2; Package Quantity: 2500
U7 = CMP-04896-000022-1: IC DIFF COMP W/STROBE 8-SOIC; Manufacturer: Texas Instruments; Standoff Height: 0.11mm; Max Junction Temp: +150°C; Voltage Gain: 200V/mV; Input Offset Voltage: 2mV; Min Supply Voltage: 3.5V; Response Time: 165ns; Max Supply Voltage: 30V; Number Of Channels: 1; Input Bias Current: 0.1uA; Nominal Supply Current: 5.1mA; Automotive: No; Temperature Range High: +70°C; Lead Free: Yes; Ambient Temperature Range Low: 0°C; ComponentLink2URL: http://www.ti.com/lit/ds/symlink/lm311.pdf; Ambient Temperature Range High: +70°C; Manufacturer Part Number: LM311D; Package: D0008A; Temperature Range Low: 0°C; RoHS: TRUE; Digikey Description: IC DIFF COMP W/STROBE 8-SOIC; ComponentLink2Description: Datasheet; Temperature: 0°C to +70°C; Height: 1.75mm; Category: IC; Device Class L1: Integrated Circuits (ICs); Ipc Land Pattern Name: SOIC127P600X175-8; Octopart: https://octopart.com/lm311d-texas+instruments-428348; Device Class L3: Comparators; Mouser Description: Analog Comparators Single Channler; Device Class L2: Linear ICs

## Sheet Microcontroller.SchDoc
size B; SheetNumber: 2; SheetTotal: 6
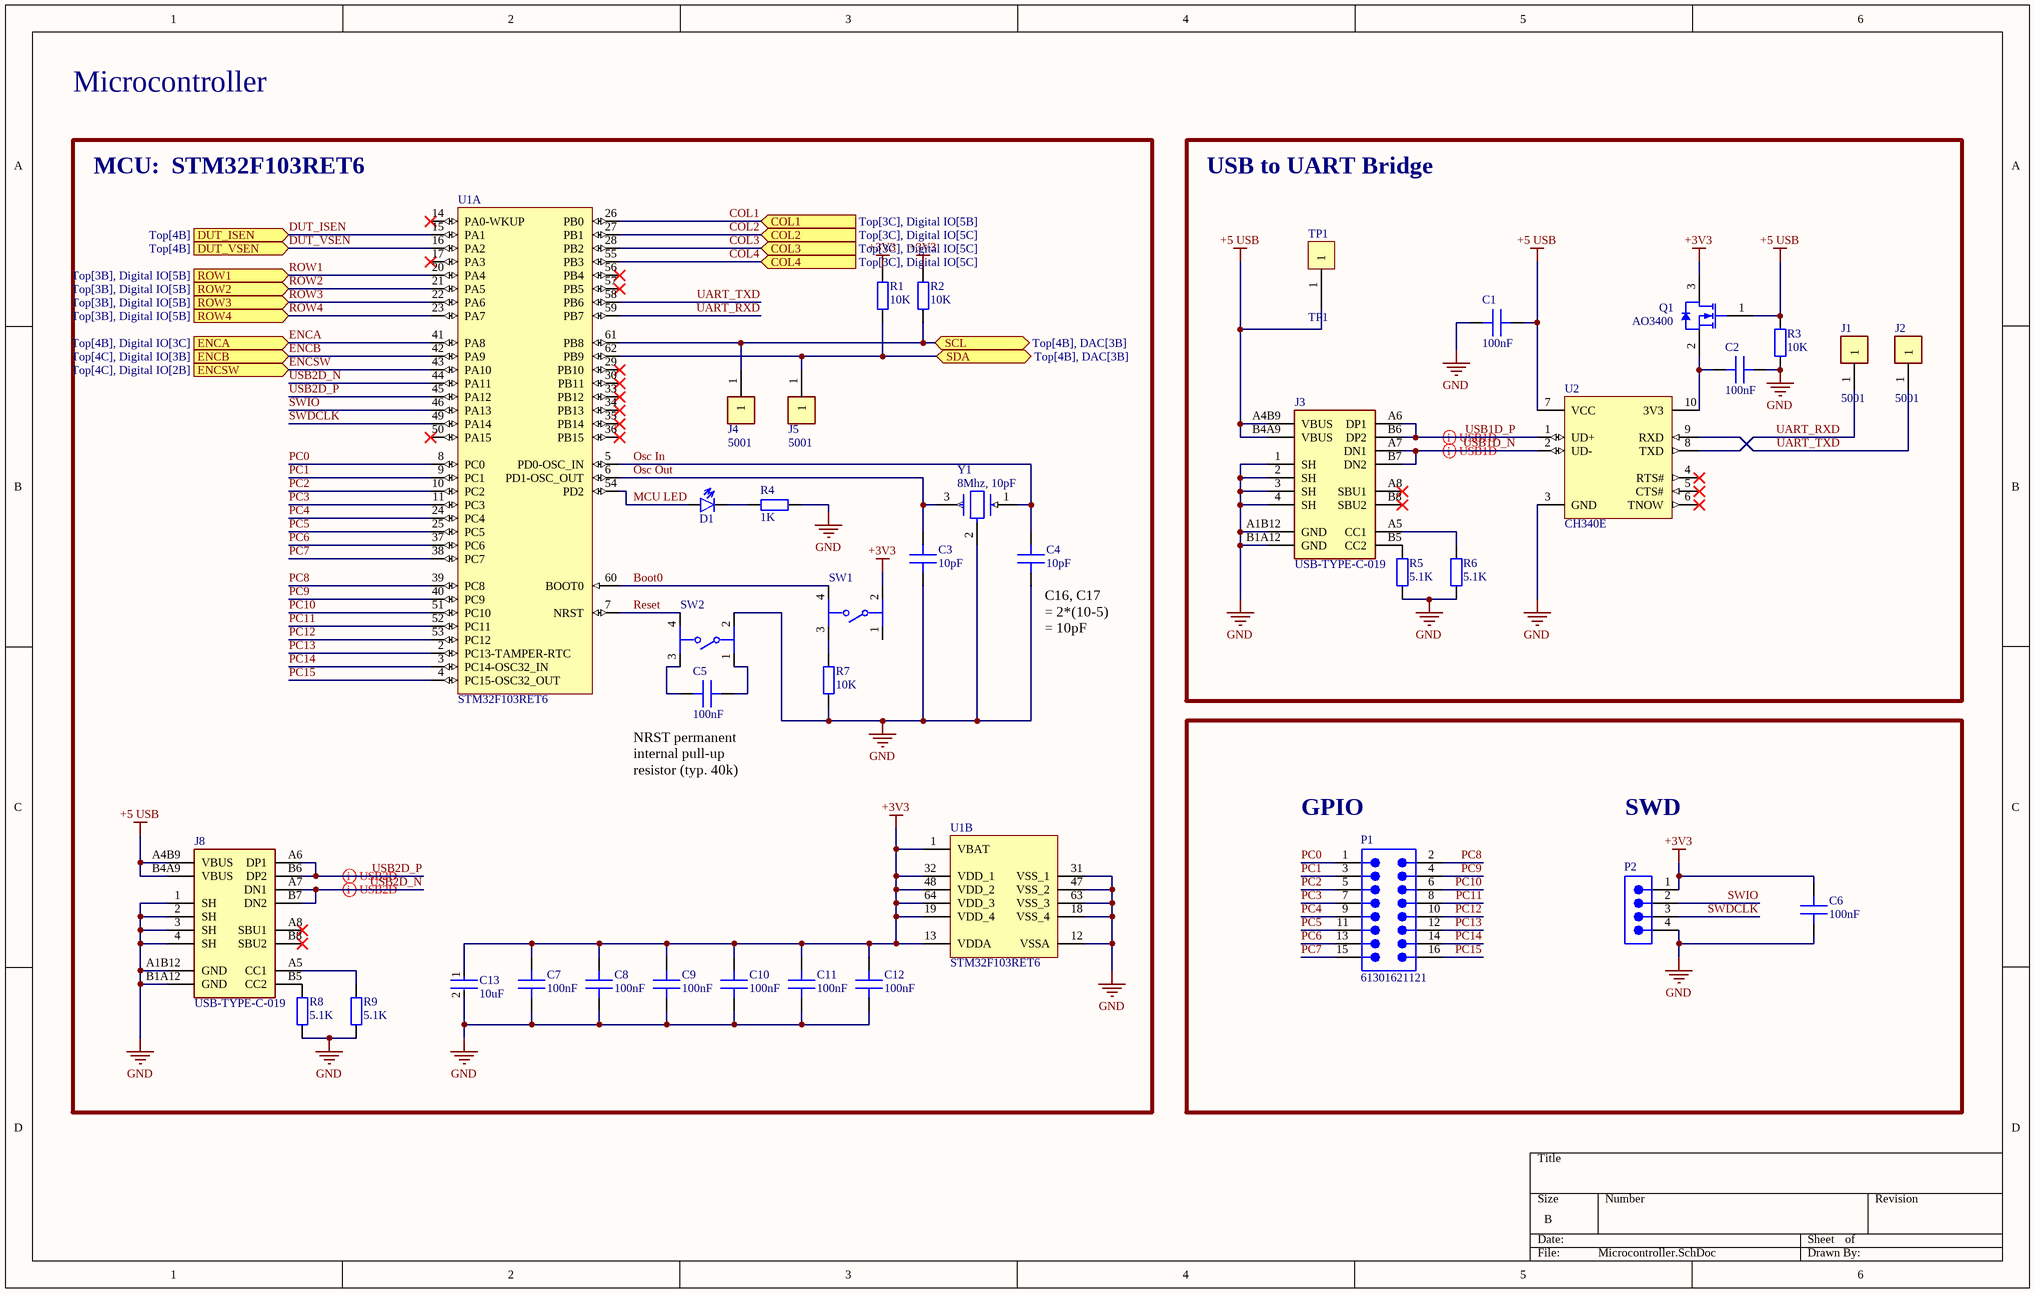
[diagram p4: Microcontroller.SchDoc]

### Parts
C1  100nF  [IPC C C0402 NO SILK]
C2  100nF  [IPC C C0402 NO SILK]
C3  10pF  [IPC C C0402 NO SILK]
C4  10pF  [IPC C C0402 NO SILK]
C5  100nF  [IPC C C0402 NO SILK]
C6  100nF  [IPC C C0402 NO SILK]
C7  100nF  [IPC C C0402 NO SILK]
C8  100nF  [IPC C C0402 NO SILK]
C9  100nF  [IPC C C0402 NO SILK]
C10  100nF  [IPC C C0402 NO SILK]
C11  100nF  [IPC C C0402 NO SILK]
C12  100nF  [IPC C C0402 NO SILK]
C13  10uF  [FP-GCM21B-0_15-MFG]
D1  CMP-006-000001-1  [IPC C D0603]  (value not drawn)
J1  5001  [FP-5001-MFG]
J2  5001  [FP-5001-MFG]
J3  USB-TYPE-C-019  [USB-TYPE-C-12+4P]
J4  5001  [FP-5001-MFG]
J5  5001  [FP-5001-MFG]
J8  USB-TYPE-C-019  [USB-TYPE-C-12+4P]
P1  61301621121  [61301621121]
P2  61300411121  [61300411121]  (value not drawn)
Q1  AO3400  [AO-SOT23-3_V]
R1  10K  [IPC C R0402 NO SILK]
R2  10K  [IPC C R0402 NO SILK]
R3  10K  [IPC C R0402 NO SILK]
R4  1K  [IPC C R0402 NO SILK]
R5  5.1K  [IPC C R0402 NO SILK]
R6  5.1K  [IPC C R0402 NO SILK]
R7  10K  [IPC C R0402 NO SILK]
R8  5.1K  [IPC C R0402 NO SILK]
R9  5.1K  [IPC C R0402 NO SILK]
SW1  C318884  [FP-PTS526SK15SMTR2LFS-MFG]  (value not drawn)
SW2  C318884  [FP-PTS526SK15SMTR2LFS-MFG]  (value not drawn)
TP1  TP1  [TP1]
U1  STM32F103RET6  [STM-LQFP64_N]  (parts A,B of 2)
U2  CH340E  [MSOP-UN10_L]
Y1  8Mhz, 10pF  [FP-CSTNE8M00GH5C000R0-MFG]

### Blocks framed on the sheet
MCU:  STM32F103RET6: C3-C5 C7-C13 D1 J4 J5 J8 R1 R2 R4 R7-R9 SW1 SW2 U1 Y1
USB to UART Bridge: C1 C2 J1-J3 Q1 R3 R5 R6 TP1 U2

### Ports
COL1 (in, see Top[3C], Digital IO[5B]), COL2 (in, see Top[3C], Digital IO[5C]), COL3 (in, see Top[3C], Digital IO[5C]), COL4 (in, see Top[3C], Digital IO[5C]), DUT_ISEN (in, see Top[4B]), DUT_VSEN (in, see Top[4B]), ENCA (in, see Top[4B], Digital IO[3C]), ENCB (in, see Top[4C], Digital IO[3B]), ENCSW (in, see Top[4C], Digital IO[2B]), ROW1 (in, see Top[3B], Digital IO[5B]), ROW2 (in, see Top[3B], Digital IO[5B]), ROW3 (in, see Top[3B], Digital IO[5B]), ROW4 (in, see Top[3B], Digital IO[5B]), SCL (bidir, see Top[4B], DAC[3B]), SDA (bidir, see Top[4B], DAC[3B])

### Nets
+3V3: C6.1 C7.1 C8.1 C9.1 C10.1 C11.1 C12.1 C13.1 P2.1 Q1.3(D) R1.2 R2.2 SW1.2 U1.1(VBAT) U1.13(VDDA) U1.19(VDD_4) U1.32(VDD_1) U1.48(VDD_2) U1.64(VDD_3)
+5 USB: C1.1 J3.A4B9(VBUS) J3.B4A9(VBUS) J8.A4B9(VBUS) J8.B4A9(VBUS) Q1.1(G) R3.2 TP1.1 U2.7(VCC)
GND: C1.2 C2.1 C3.1 C4.1 C6.2 C7.2 C8.2 C9.2 C10.2 C11.2 C12.2 C13.2 J3.1(SH) J3.2(SH) J3.3(SH) J3.4(SH) J3.A1B12(GND) J3.B1A12(GND) J8.1(SH) J8.2(SH) J8.3(SH) J8.4(SH) J8.A1B12(GND) J8.B1A12(GND) P2.4 R3.1 R4.1 R5.1 R6.1 R7.1 R8.1 R9.1 SW2.2 U1.12(VSSA) U1.18(VSS_4) U1.31(VSS_1) U1.47(VSS_2) U1.63(VSS_3) U2.3(GND) Y1.2(GND)
Boot0: SW1.4 U1.60(BOOT0)
COL1: U1.26(PB0) ; port COL1
COL2: U1.27(PB1) ; port COL2
COL3: U1.28(PB2) ; port COL3
COL4: U1.55(PB3) ; port COL4
DUT_ISEN: U1.15(PA1) ; port DUT_ISEN
DUT_VSEN: U1.16(PA2) ; port DUT_VSEN
ENCA: U1.41(PA8) ; port ENCA
ENCB: U1.42(PA9) ; port ENCB
ENCSW: U1.43(PA10) ; port ENCSW
MCU LED: D1.1(A) U1.54(PD2)
Osc In: C4.2 U1.5(PD0-OSC_IN) Y1.1(Input)
Osc Out: C3.2 U1.6(PD1-OSC_OUT) Y1.3(Output)
PC0: P1.1 U1.8(PC0)
PC1: P1.3 U1.9(PC1)
PC2: P1.5 U1.10(PC2)
PC3: P1.7 U1.11(PC3)
PC4: P1.9 U1.24(PC4)
PC5: P1.11 U1.25(PC5)
PC6: P1.13 U1.37(PC6)
PC7: P1.15 U1.38(PC7)
PC8: P1.2 U1.39(PC8)
PC9: P1.4 U1.40(PC9)
PC10: P1.6 U1.51(PC10)
PC11: P1.8 U1.52(PC11)
PC12: P1.10 U1.53(PC12)
PC13: P1.12 U1.2(PC13-TAMPER-RTC)
PC14: P1.14 U1.3(PC14-OSC32_IN)
PC15: P1.16 U1.4(PC15-OSC32_OUT)
Reset: SW2.4 U1.7(NRST)
ROW1: U1.20(PA4) ; port ROW1
ROW2: U1.21(PA5) ; port ROW2
ROW3: U1.22(PA6) ; port ROW3
ROW4: U1.23(PA7) ; port ROW4
SWDCLK: P2.3 U1.49(PA14)
SWIO: P2.2 U1.46(PA13)
UART_RXD: J1.1 U1.59(PB7) U2.8(TXD)
UART_TXD: J2.1 U1.58(PB6) U2.9(RXD)
USB1D_N: J3.A7(DN1) J3.B7(DN2) U2.2(UD-)
USB1D_P: J3.A6(DP1) J3.B6(DP2) U2.1(UD+)
USB2D_N: J8.A7(DN1) J8.B7(DN2) U1.44(PA11)
USB2D_P: J8.A6(DP1) J8.B6(DP2) U1.45(PA12)
NetC2_2: C2.2 Q1.2(S) U2.10(3V3)
NetC5_1: C5.1 SW2.1
NetC5_2: C5.2 SW2.3
NetD1_2: D1.2(C) R4.2
NetJ3_A5: J3.A5(CC1) R6.2
NetJ3_B5: J3.B5(CC2) R5.2
NetJ4_1: J4.1 R2.1 U1.61(PB8) ; port SCL
NetJ5_1: J5.1 R1.1 U1.62(PB9) ; port SDA
NetJ8_A5: J8.A5(CC1) R9.2
NetJ8_B5: J8.B5(CC2) R8.2
NetR7_2: R7.2 SW1.3

Not connected (* = marked no-connect by the designer): J3 A8(SBU1)* B8(SBU2)*; J8 A8(SBU1)* B8(SBU2)*; SW1 1; U1 14(PA0-WKUP)* 17(PA3)* 29(PB10)* 30(PB11)* 33(PB12)* 34(PB13)* 35(PB14)* 36(PB15)* 50(PA15)* 56(PB4)* 57(PB5)*; U2 4(RTS#)* 5(CTS#)* 6(TNOW)*

### Layout directives
differential pair; differential pair class USB1D: USB1D_N, USB1D_P
differential pair; differential pair class USB2D: USB2D_N, USB2D_P

### Notes on the sheet
- Microcontroller
- (near C4) C16, C17 = 2*(10-5) = 10pF
- (near C5) NRST permanent internal pull-up resistor (typ. 40k)
- (near P1) GPIO
- SWD

### Library data of the parts
C1-C12 = CMP-002-000000-1: Source: Schlib1.SchLib; Design Item ID: Generic CAP 0402
  C1 C2 C5-C12: Value: 100nF
  C3 C4: Value: 10pF
C13 = CMP-06035-012904-1: Ceramic Capacitor for Automotive 10uF ±10% 6.3VDC X7R 0805 Embossed T/R GCM21BR70J106KE22K; Voltage Rating (DC): 6.3V; Lead Free: Lead Free; Length: 2mm; Case/Package: 0805; Packaging: Tape and Reel; Max Operating Temperature: 125°C; Depth: 1.25mm; Dielectric: X7R; Value: 10uF; Tolerance: 10%; Min Operating Temperature: -55°C
J1 J2 J4 J5 = CMP-2000-05181-2: as J9 on sheet DAC; Insulation Material: Nylon; Mount: Through Hole; RoHS Compliant: Yes; Series: THM; Height: 0.3inch; Termination: Through Hole; Material: Nylon; Packaging: Bulk; Contact Material: Bronze; REACH SVHC: No SVHC; Contact Plating: Silver; Orientation: Straight; Lead Free: Lead Free; Package Quantity: 100; Length: 7.62mm; Flammability Rating: UL94 V-0; Number of Contacts: 1; Diameter: 2.54mm; Housing Color: Black; Color: Black
J3 J8 = CMP-003-000000-1: Connector Type:Type-C Standard:- Gender:Female Number of Contacts:16 Number of Ports:1 Mounting Style:Surface Mount Current Rating - Power (Max):3A Operating Temperature Range:-25℃~+85℃ Operating Temperature Range:-25℃~+85℃; Manufacturer: DEALON(德艺隆); Add into BOM: yes; Connector Type: Type-C; Gender: Female; Number of Contacts: 16; Number of Ports: 1; Current Rating - Power (Max): 3A; Symbol: USB-TYPE-C-019; Device: USB-TYPE-C-019; LCSC Part Name: Type-C 母座 卧贴; Supplier Part: C2927039; Manufacturer Part: USB-TYPE-C-019; Supplier Footprint: SMD; JLCPCB Part Class: Extended Part; Datasheet: https://atta.szlcsc.com/upload/public/pdf/source/20211217/CCD3D517E355E8E0CC52ABD8D5784AD8.pdf; Convert to PCB: yes; Standard: -; Mounting Style: Surface Mount; Operating Temperature Range: -25℃~+85℃; Design Item ID: USB-TYPE-C-019; Source: Schlib1.SchLib
P1 = CMP-1502-01097-3: as P3 on sheet Top; Min Operating Temperature: -40°C; Contact Material: Copper; RoHS: Compliant; Lead Pitch: 2.54mm; Color: Black; Contact Mating Length: 5.9944mm; REACH SVHC: Unknown; Number of Rows: 2; Orientation: Vertical; Number of Positions: 16; Max Operating Temperature: 105°C; Termination: Solder; Packaging: Bulk; Height: 8.89mm; Mount: Through Hole; Contact Plating: Gold; Voltage Rating: 250V; Number of Pins: 16; Pitch: 2.54mm
P2 = CMP-1502-01064-2: NexarPartId: 32855522; Pitch: 2.54mm; Number of Contacts: 4; Contact Resistance: 20mΩ; Gender: Male; Current Rating: 3A; Connector Type: Male Pin; Voltage Rating: 250V; Lead Free: Lead Free; Contact Plating: Gold; Max Operating Temperature: 105°C; Packaging: Bulk; Height: 8.89mm; Orientation: Vertical; Contact Mating Length: 5.9944mm; Contact Material: Copper; Lead Pitch: 2.54mm; Min Operating Temperature: -40°C; Termination: Solder; Color: Black; Number of Rows: 1; REACH SVHC: Unknown; RoHS: Compliant; Mount: Through Hole; Number of Positions: 4; Number of Pins: 4; Operating Supply Voltage: 250V
Q1 = CMP-0278-00001-1: N-channel Enhancement Mode Field-Effect Transistor; 5.8A/30V; Manufacturer: Alpha and Omega; Channel Type: N; Drain-Source Voltage Limit: 30 V; Junction Temperature: -55 to 150 degC; Gate-Source Voltage Limit: +/-12 V; PackageDescription: 3-Pin SOT23, 3.016 x 2.8 mm Body, 0.95 mm Pitch; ComponentLink2Description: Datasheet; DatasheetVersion: Rev.8, 12/2011; ComponentLink3URL: http://www.aosmd.com/res/packaging_information/SOT-23.pdf; Storage Temperature: -55 to 150 degC; ComponentLink3Description: Package Specification; PackageReference: SOT23; ComponentLink1Description: Manufacturer URL; Mounting Technology: Surface Mount; ComponentLink1URL: http://www.aosmd.com/; PartNumber: AO3400; ComponentLink2URL: http://www.aosmd.com/res/data_sheets/AO3400.pdf
R1-R9 = CMP-008-000000-1: Source: Schlib1.SchLib; Design Item ID: Generic RES 0402
  R1-R3 R7: Value: 10K
  R4: Value: 1K
  R5 R6 R8 R9: Value: 5.1K
SW1 SW2 = CMP-10040-000013-1: TACT 5.2 X 5.2, 1.5 MM H, 260GF, C318884; Manufacturer: C&K; Manufacturer Part Number: PTS526SK15SMTR2LFS; Operating Force: 250gf; Throw Configuration: SPST-NO; Contact Current Rating: 50mA; Standoff Height: 0mm; Contact Resistance: 100mΩ; Voltage Rating Dc: 12V; Electromechanical Life: 200000Cycles; Device Class L3: Tactile Switches; Device Class L2: Switches; Temperature: -20°C to +70°C; Temperature Range Low: -20°C; Package: PTS526SK15SMTR2LFS; Temperature Range High: +70°C; ComponentLink2Description: Datasheet; Device Class L1: Electromechanical; Height: 1.65mm; Digikey Description: TACT 5.2 X 5.2, 1.5 MM H, 260GF,; Category: Switch; RoHS: TRUE; Automotive: No; Lead Free: Yes; Octopart: https://octopart.com/pts526+sk15+smtr2+lfs-c%26k+components-100617999; ComponentLink2URL: https://www.ckswitches.com/media/2780/pts526.pdf
TP1 = CMP-00003-3: Testpoint double sided
U1 = CMP-0237-00201-3: ARM Cortex-M3 32-bit MCU, 512 KB Flash, 64 KB Internal RAM, 51 I/Os, 64-pin LQFP, -40 to 85 degC, Tray; FLASH Size (Prog) (kB): 512; Internal RAM Size (kB): 64; A/D Converter: 3x12-bit (16 Channel); I/Os (High Current): 51; Supply Voltage(Vcc) min (V): 2; D/A Converter: 2x12-bit (2 Channel); Operating Frequency(F) (Processor speed) (MHz): 72; PackageDescription: 64-Pin Low Profile Quad Flat Package, 10 x 10 mm Body, 0.5 mm Pitch; ComponentLink3URL: http://www.st.com/st-web-ui/static/active/en/resource/technical/document/datasheet/DM00037051.pdf; DatasheetVersion: Rev. 8; Packing: Tray; PackageReference: LQFP64; ComponentLink3Description: Package Specification; Core: ARM Cortex-M3; Mounting Technology: Surface Mount; PartNumber: STM32F103RET6; PackageVersion: Rev. 4, 06/2013; ComponentLink1URL: http://www.st.com/web/en/home.html; ComponentLink1Description: Manufacturer URL; ComponentLink2Description: Datasheet; ComponentLink2URL: http://www.st.com/st-web-ui/static/active/en/resource/technical/document/datasheet/CD00191185.pdf
U2 = CMP-010-000001-1: Source: Schlib1.SchLib; Design Item ID: CH340E
Y1 = CMP-06057-000001-1: MFR.Part # / CSTCE8M00G52-R0 Copy / JLCPCB Part # / C22549 Copy / Package / SMD3213-3P Copy / Description / 8MHz ±0.5% 10pF 40Ω SMD3213-3P Ceramic Resonators ROHS; Frequency Stability: 0.13%; Capacitance: 33pF; Frequency Tolerance: 0.07%; Impedance: 40R; Mount: Surface Mount; Min Operating Temperature: -40°C; Max Operating Temperature: 125°C; Resistor Type: Ceramic; Packaging: Tape and Reel; Frequency: 8MHz; Case/Package: SMD/SMT
D1 = CMP-006-000001-1: Design Item ID: Generic LED 0603; Source: Schlib1.SchLib

## Nets that join several sheets
5V_Sel: Power Distribution (7 pins), DAC (C23.2 U6.2)
+3V3: Top (P3.3), Power Distribution (6 pins), Microcontroller (19 pins)
+4.096V: Top (P3.4 P3.13), DAC (6 pins)
+5 USB: Power Distribution (D6.2 Q3.1 R26.2), Microcontroller (9 pins)
+12V: Top (J13.1 P3.16), Power Distribution (5 pins), Thermal (D5.2 R19.1 R20.3 U7.8)
GND: Top (8 pins), Power Distribution (17 pins), DAC (6 pins), Thermal (5 pins), Microcontroller (40 pins)
DUT_ISEN: Top (P3.5), Microcontroller (U1.15)
DUT_VSEN: Top (P3.10), Microcontroller (U1.16)
FAN-: Top (P3.14), Thermal (D5.1 Q2.3)
LOAD_CTRL: Top (P3.6), DAC (J9.1 R14.2 U5.1)
NetJ4_1: DAC (U5.5), Microcontroller (J4.1 R2.1 U1.61)
NetJ5_1: DAC (U5.4), Microcontroller (J5.1 R1.1 U1.62)
TEMP_IN+: Top (P3.9), Thermal (R19.2 U7.3)